# Altium schematic sheet Peripheral_Section.SchDoc
size A4; DocumentNumber: 8; SheetNumber: 8; SheetTotal: 13
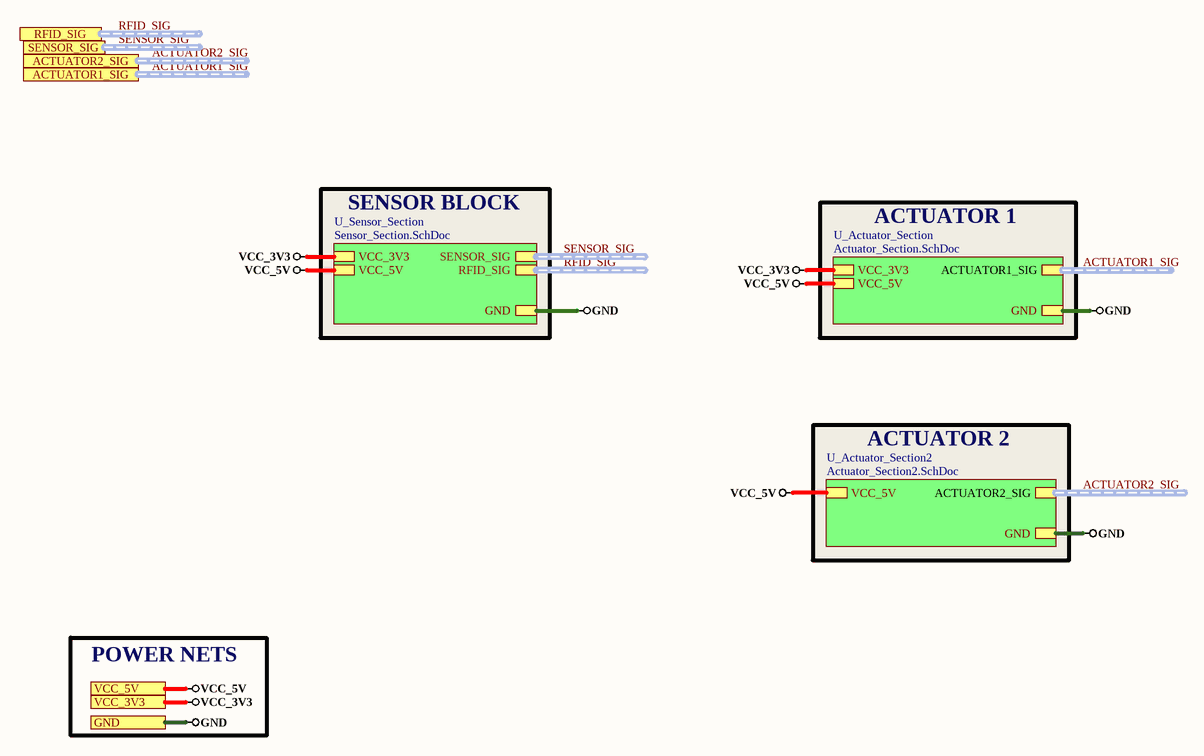
[diagram p0: Peripheral_Section.SchDoc]

## Sub-sheets
U_Actuator_Section = Actuator_Section.SchDoc: ACTUATOR1_SIG (harness ACTUATOR1_SIG), GND, VCC_3V3, VCC_5V
U_Actuator_Section2 = Actuator_Section2.SchDoc: ACTUATOR2_SIG (harness ACTUATOR2_SIG), GND, VCC_5V
U_Sensor_Section = Sensor_Section.SchDoc: GND, VCC_3V3, VCC_5V, SENSOR_SIG (harness SENSOR_SIG), RFID_SIG (harness RFID_SIG)

## Ports
ACTUATOR1_SIG (harness ACTUATOR1_SIG), ACTUATOR2_SIG (harness ACTUATOR2_SIG), GND, RFID_SIG (harness RFID_SIG), SENSOR_SIG (harness SENSOR_SIG), VCC_3V3, VCC_5V

## Nets
GND: port GND, sheet U_Sensor_Section/GND, sheet U_Actuator_Section/GND, sheet U_Actuator_Section2/GND
VCC_3V3: port VCC_3V3, sheet U_Sensor_Section/VCC_3V3, sheet U_Actuator_Section/VCC_3V3
VCC_5V: port VCC_5V, sheet U_Sensor_Section/VCC_5V, sheet U_Actuator_Section/VCC_5V, sheet U_Actuator_Section2/VCC_5V

## Buses and harness runs
harness ACTUATOR1_SIG = port ACTUATOR1_SIG
harness ACTUATOR1_SIG = sheet U_Actuator_Section/ACTUATOR1_SIG
harness ACTUATOR2_SIG = port ACTUATOR2_SIG
harness ACTUATOR2_SIG = sheet U_Actuator_Section2/ACTUATOR2_SIG
harness RFID_SIG = port RFID_SIG
harness RFID_SIG = sheet U_Sensor_Section/RFID_SIG
harness SENSOR_SIG = port SENSOR_SIG
harness SENSOR_SIG = sheet U_Sensor_Section/SENSOR_SIG

## Notes on the sheet
- SENSOR BLOCK
- ACTUATOR 1
- ACTUATOR 2
- POWER NETS